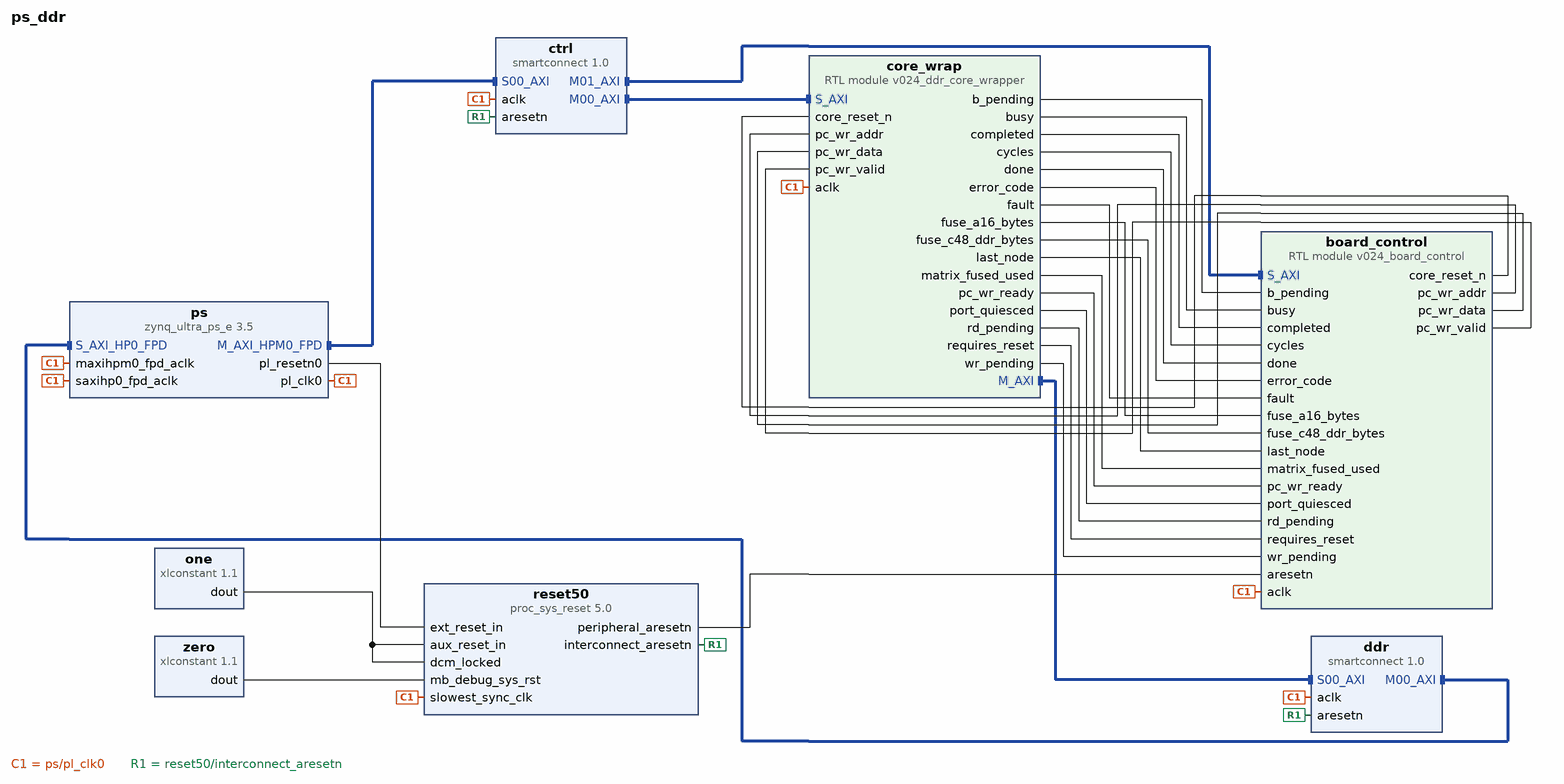
[diagram p0: block diagram of the top level]
# Vivado block design ps_ddr, xczu15eg-ffvb1156-2-i, Vivado 2025.2
create_bd_design ps_ddr

create_bd_cell -type ip -vlnv xilinx.com:ip:zynq_ultra_ps_e:3.5 ps
set_property -dict [list \
  CONFIG.PSU_BANK_0_IO_STANDARD LVCMOS18 \
  CONFIG.PSU_BANK_1_IO_STANDARD LVCMOS18 \
  CONFIG.PSU_BANK_2_IO_STANDARD LVCMOS18 \
  CONFIG.PSU_USB3__DUAL_CLOCK_ENABLE 0 \
  CONFIG.PSU__CAN1__PERIPHERAL__ENABLE 0 \
  CONFIG.PSU__CRF_APB__DDR_CTRL__FREQMHZ 1200 \
  CONFIG.PSU__CRF_APB__DDR_CTRL__SRCSEL DPLL \
  CONFIG.PSU__CRF_APB__DP_AUDIO_REF_CTRL__SRCSEL RPLL \
  CONFIG.PSU__CRF_APB__DP_STC_REF_CTRL__SRCSEL RPLL \
  CONFIG.PSU__CRF_APB__DP_VIDEO_REF_CTRL__SRCSEL VPLL \
  CONFIG.PSU__CRF_APB__TOPSW_MAIN_CTRL__SRCSEL APLL \
  CONFIG.PSU__CRL_APB__CAN1_REF_CTRL__SRCSEL IOPLL \
  CONFIG.PSU__CRL_APB__PL0_REF_CTRL__FREQMHZ 50 \
  CONFIG.PSU__CRL_APB__SDIO0_REF_CTRL__SRCSEL IOPLL \
  CONFIG.PSU__CRL_APB__SDIO1_REF_CTRL__SRCSEL IOPLL \
  CONFIG.PSU__CRL_APB__USB3__ENABLE 0 \
  CONFIG.PSU__DDRC__BUS_WIDTH {64 Bit} \
  CONFIG.PSU__DDRC__COMPONENTS Components \
  CONFIG.PSU__DDRC__DEVICE_CAPACITY {8192 MBits} \
  CONFIG.PSU__DDRC__DRAM_WIDTH {16 Bits} \
  CONFIG.PSU__DDRC__ECC Disabled \
  CONFIG.PSU__DDRC__MEMORY_TYPE {DDR 4} \
  CONFIG.PSU__DDRC__SPEED_BIN DDR4_2400P \
  CONFIG.PSU__DDR_HIGH_ADDRESS_GUI_ENABLE 1 \
  CONFIG.PSU__DDR__INTERFACE__FREQMHZ 600.000 \
  CONFIG.PSU__DISPLAYPORT__PERIPHERAL__ENABLE 0 \
  CONFIG.PSU__DLL__ISUSED 0 \
  CONFIG.PSU__ENET3__PERIPHERAL__ENABLE 0 \
  CONFIG.PSU__FPGA_PL0_ENABLE 1 \
  CONFIG.PSU__GPIO0_MIO__PERIPHERAL__ENABLE 0 \
  CONFIG.PSU__GPIO1_MIO__PERIPHERAL__ENABLE 0 \
  CONFIG.PSU__I2C0__PERIPHERAL__ENABLE 0 \
  CONFIG.PSU__I2C1__PERIPHERAL__ENABLE 0 \
  CONFIG.PSU__MAXIGP0__DATA_WIDTH 128 \
  CONFIG.PSU__PCIE__CLASS_CODE_SUB 0x04 \
  CONFIG.PSU__PMU__PERIPHERAL__ENABLE 0 \
  CONFIG.PSU__QSPI__PERIPHERAL__ENABLE 0 \
  CONFIG.PSU__SATA__PERIPHERAL__ENABLE 0 \
  CONFIG.PSU__SD0__CLK_100_SDR_OTAP_DLY 0x0 \
  CONFIG.PSU__SD0__CLK_200_SDR_OTAP_DLY 0x3 \
  CONFIG.PSU__SD0__CLK_50_DDR_ITAP_DLY 0x12 \
  CONFIG.PSU__SD0__CLK_50_DDR_OTAP_DLY 0x6 \
  CONFIG.PSU__SD0__CLK_50_SDR_ITAP_DLY 0x15 \
  CONFIG.PSU__SD0__CLK_50_SDR_OTAP_DLY 0x6 \
  CONFIG.PSU__SD0__RESET__ENABLE 1 \
  CONFIG.PSU__SD1__CLK_100_SDR_OTAP_DLY 0x0 \
  CONFIG.PSU__SD1__CLK_200_SDR_OTAP_DLY 0x0 \
  CONFIG.PSU__SD1__CLK_50_DDR_ITAP_DLY 0x0 \
  CONFIG.PSU__SD1__CLK_50_DDR_OTAP_DLY 0x0 \
  CONFIG.PSU__SD1__CLK_50_SDR_ITAP_DLY 0x15 \
  CONFIG.PSU__SD1__CLK_50_SDR_OTAP_DLY 0x5 \
  CONFIG.PSU__SD1__PERIPHERAL__ENABLE 0 \
  CONFIG.PSU__SWDT0__PERIPHERAL__ENABLE 0 \
  CONFIG.PSU__SWDT1__PERIPHERAL__ENABLE 0 \
  CONFIG.PSU__TTC0__PERIPHERAL__ENABLE 0 \
  CONFIG.PSU__TTC1__PERIPHERAL__ENABLE 0 \
  CONFIG.PSU__TTC2__PERIPHERAL__ENABLE 0 \
  CONFIG.PSU__TTC3__PERIPHERAL__ENABLE 0 \
  CONFIG.PSU__UART0__PERIPHERAL__ENABLE 0 \
  CONFIG.PSU__UART1__PERIPHERAL__ENABLE 0 \
  CONFIG.PSU__USB0__PERIPHERAL__ENABLE 0 \
  CONFIG.PSU__USB0__RESET__ENABLE 1 \
  CONFIG.PSU__USB0__RESET__IO {MIO 32} \
  CONFIG.PSU__USE__DDR_INTF_REQUESTED 1 \
  CONFIG.PSU__USE__M_AXI_GP0 1 \
  CONFIG.PSU__USE__M_AXI_GP1 0 \
  CONFIG.PSU__USE__M_AXI_GP2 0 \
  CONFIG.PSU__USE__S_AXI_GP2 1 \
  CONFIG.SUBPRESET1 Custom \
] [get_bd_cells ps]
# 158 more settings of ps are not shown: defaults, MIO pin electricals, DDR timing, and values the tool derives
create_bd_cell -type module -reference v024_ddr_core_wrapper core_wrap
create_bd_cell -type module -reference v024_board_control board_control
create_bd_cell -type ip -vlnv xilinx.com:ip:smartconnect:1.0 ctrl
set_property -dict {CONFIG.NUM_CLKS 1 CONFIG.NUM_MI 2 CONFIG.NUM_SI 1} [get_bd_cells ctrl]
create_bd_cell -type ip -vlnv xilinx.com:ip:smartconnect:1.0 ddr
set_property -dict {CONFIG.NUM_CLKS 1 CONFIG.NUM_MI 1 CONFIG.NUM_SI 1} [get_bd_cells ddr]
create_bd_cell -type ip -vlnv xilinx.com:ip:proc_sys_reset:5.0 reset50
set_property -dict {CONFIG.C_AUX_RESET_HIGH 0} [get_bd_cells reset50]
create_bd_cell -type ip -vlnv xilinx.com:ip:xlconstant:1.1 one
set_property -dict {CONFIG.CONST_VAL 1} [get_bd_cells one]
create_bd_cell -type ip -vlnv xilinx.com:ip:xlconstant:1.1 zero
set_property -dict {CONFIG.CONST_VAL 0} [get_bd_cells zero]

# ---- connections ----

connect_bd_intf_net [get_bd_intf_pins core_wrap/M_AXI] [get_bd_intf_pins ddr/S00_AXI]
connect_bd_intf_net [get_bd_intf_pins ctrl/M00_AXI] [get_bd_intf_pins core_wrap/S_AXI]
connect_bd_intf_net [get_bd_intf_pins ctrl/M01_AXI] [get_bd_intf_pins board_control/S_AXI]
connect_bd_intf_net [get_bd_intf_pins ddr/M00_AXI] [get_bd_intf_pins ps/S_AXI_HP0_FPD]
connect_bd_intf_net [get_bd_intf_pins ps/M_AXI_HPM0_FPD] [get_bd_intf_pins ctrl/S00_AXI]
connect_bd_net [get_bd_pins board_control/core_reset_n] [get_bd_pins core_wrap/core_reset_n]
connect_bd_net [get_bd_pins board_control/pc_wr_addr] [get_bd_pins core_wrap/pc_wr_addr]
connect_bd_net [get_bd_pins board_control/pc_wr_data] [get_bd_pins core_wrap/pc_wr_data]
connect_bd_net [get_bd_pins board_control/pc_wr_valid] [get_bd_pins core_wrap/pc_wr_valid]
connect_bd_net [get_bd_pins core_wrap/b_pending] [get_bd_pins board_control/b_pending]
connect_bd_net [get_bd_pins core_wrap/busy] [get_bd_pins board_control/busy]
connect_bd_net [get_bd_pins core_wrap/completed] [get_bd_pins board_control/completed]
connect_bd_net [get_bd_pins core_wrap/cycles] [get_bd_pins board_control/cycles]
connect_bd_net [get_bd_pins core_wrap/done] [get_bd_pins board_control/done]
connect_bd_net [get_bd_pins core_wrap/error_code] [get_bd_pins board_control/error_code]
connect_bd_net [get_bd_pins core_wrap/fault] [get_bd_pins board_control/fault]
connect_bd_net [get_bd_pins core_wrap/fuse_a16_bytes] [get_bd_pins board_control/fuse_a16_bytes]
connect_bd_net [get_bd_pins core_wrap/fuse_c48_ddr_bytes] [get_bd_pins board_control/fuse_c48_ddr_bytes]
connect_bd_net [get_bd_pins core_wrap/last_node] [get_bd_pins board_control/last_node]
connect_bd_net [get_bd_pins core_wrap/matrix_fused_used] [get_bd_pins board_control/matrix_fused_used]
connect_bd_net [get_bd_pins core_wrap/pc_wr_ready] [get_bd_pins board_control/pc_wr_ready]
connect_bd_net [get_bd_pins core_wrap/port_quiesced] [get_bd_pins board_control/port_quiesced]
connect_bd_net [get_bd_pins core_wrap/rd_pending] [get_bd_pins board_control/rd_pending]
connect_bd_net [get_bd_pins core_wrap/requires_reset] [get_bd_pins board_control/requires_reset]
connect_bd_net [get_bd_pins core_wrap/wr_pending] [get_bd_pins board_control/wr_pending]
connect_bd_net [get_bd_pins one/dout] [get_bd_pins reset50/aux_reset_in] [get_bd_pins reset50/dcm_locked]
connect_bd_net [get_bd_pins ps/pl_clk0] \
  [get_bd_pins ps/maxihpm0_fpd_aclk] [get_bd_pins ps/saxihp0_fpd_aclk] [get_bd_pins ctrl/aclk] [get_bd_pins ddr/aclk] \
  [get_bd_pins core_wrap/aclk] [get_bd_pins board_control/aclk] [get_bd_pins reset50/slowest_sync_clk]
connect_bd_net [get_bd_pins ps/pl_resetn0] [get_bd_pins reset50/ext_reset_in]
connect_bd_net [get_bd_pins reset50/interconnect_aresetn] [get_bd_pins ctrl/aresetn] [get_bd_pins ddr/aresetn]
connect_bd_net [get_bd_pins reset50/peripheral_aresetn] [get_bd_pins board_control/aresetn]
connect_bd_net [get_bd_pins zero/dout] [get_bd_pins reset50/mb_debug_sys_rst]

# ---- address map ----
assign_bd_address -offset 0x0000000000 -range 2G -target_address_space [get_bd_addr_spaces core_wrap/M_AXI] [get_bd_addr_segs ps/SAXIGP2/HP0_DDR_LOW]
exclude_bd_addr_seg -offset 0x0000000000 -range 1 -target_address_space [get_bd_addr_spaces core_wrap/M_AXI] [get_bd_addr_segs ps/SAXIGP2/HP0_DDR_HIGH]
exclude_bd_addr_seg -offset 0x0000000000 -range 1 -target_address_space [get_bd_addr_spaces core_wrap/M_AXI] [get_bd_addr_segs ps/SAXIGP2/HP0_LPS_OCM]
assign_bd_address -offset 0x00A0000000 -range 16M -target_address_space [get_bd_addr_spaces ps/Data] [get_bd_addr_segs core_wrap/S_AXI/reg0]
assign_bd_address -offset 0x00A1000000 -range 64K -target_address_space [get_bd_addr_spaces ps/Data] [get_bd_addr_segs board_control/S_AXI/reg0]

validate_bd_design
save_bd_design
